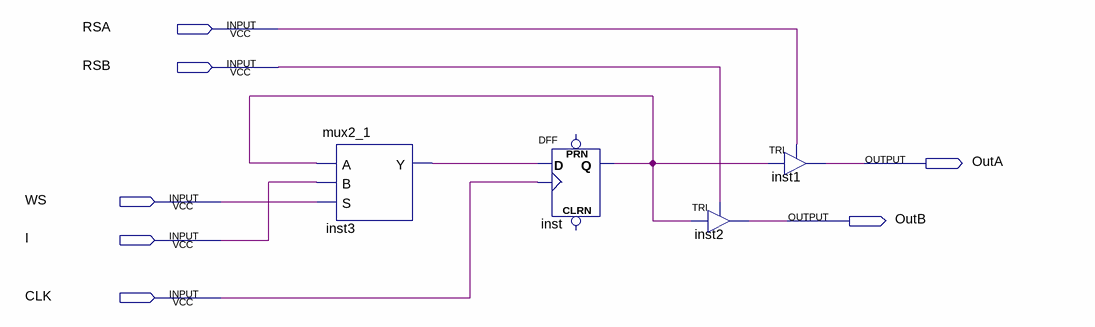
[diagram p0: schematic sheet]
// Quartus schematic reg_file_cel_1.bdf as structural Verilog: 4 symbols, 7 pins
module reg_file_cel_1 (
  input  RSA,
  input  RSB,
  input  WS,
  input  I,
  input  CLK,
  output OutA,
  output OutB
);

  wire inst3_y, inst_q;

  mux2_1 inst3 (.A(inst_q), .B(I), .S(WS), .Y(inst3_y));
  DFF inst (.CLK(CLK), .D(inst3_y), .Q(inst_q));  // open: CLRN, PRN
  TRI inst2 (.IN(inst_q), .OE(RSB), .OUT(OutB));
  TRI inst1 (.IN(inst_q), .OE(RSA), .OUT(OutA));
endmodule
